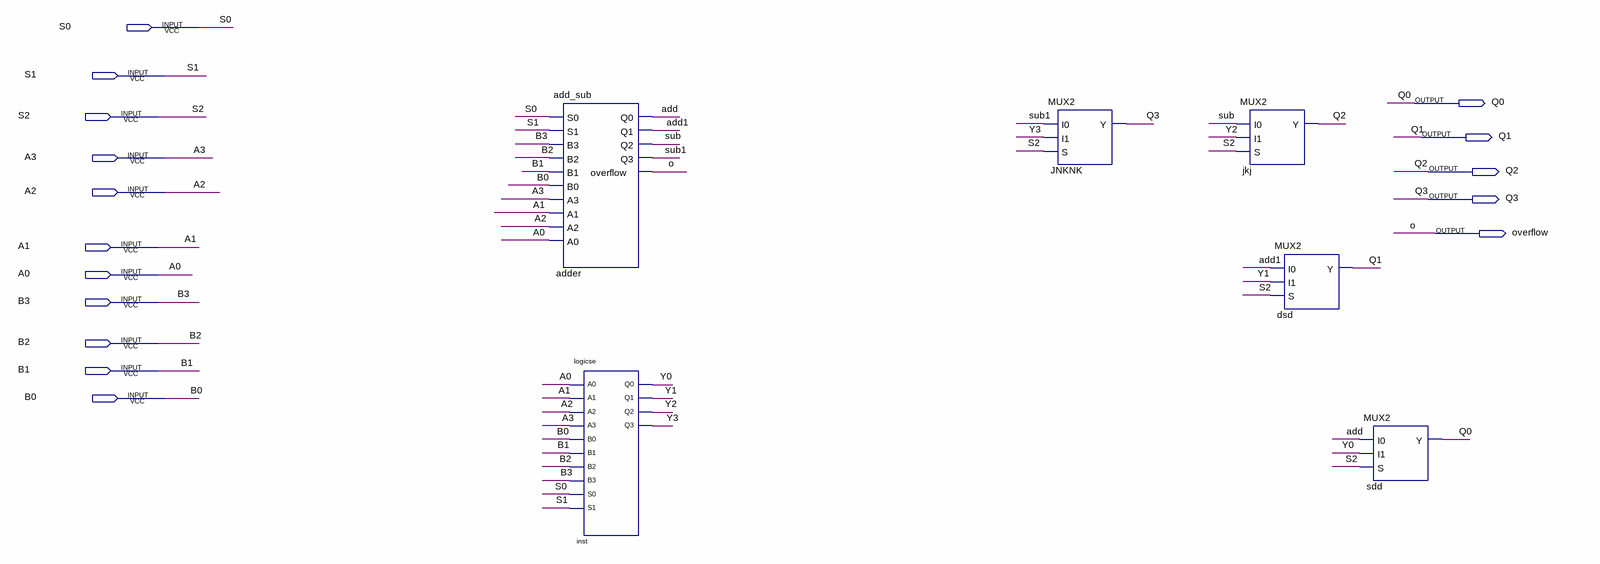
[diagram p0: schematic sheet]
// Quartus schematic ALU.bdf as structural Verilog: 6 symbols, 16 pins
module ALU (
  input  S0,
  input  S1,
  input  S2,
  input  A3,
  input  A2,
  input  A1,
  input  A0,
  input  B3,
  input  B2,
  input  B1,
  input  B0,
  output Q0,
  output Q1,
  output Q2,
  output Q3,
  output overflow
);

  wire add, add1, sub, sub1, Y0, Y1, Y2, Y3;

  add_sub adder (
    .S0(S0), .S1(S1), .B3(B3), .B2(B2), .B1(B1), .B0(B0), .A3(A3), .A1(A1), .A2(A2), .A0(A0), .Q0(add),
    .Q1(add1), .Q2(sub), .Q3(sub1), .overflow(overflow));
  logicse inst (
    .A0(A0), .A1(A1), .A2(A2), .A3(A3), .B0(B0), .B1(B1), .B2(B2), .B3(B3), .S0(S0), .S1(S1), .Q0(Y0),
    .Q1(Y1), .Q2(Y2), .Q3(Y3));
  MUX2 JNKNK (.I0(sub1), .I1(Y3), .S(S2), .Y(Q3));
  MUX2 jkj (.I0(sub), .I1(Y2), .S(S2), .Y(Q2));
  MUX2 dsd (.I0(add1), .I1(Y1), .S(S2), .Y(Q1));
  MUX2 sdd (.I0(add), .I1(Y0), .S(S2), .Y(Q0));

  // Other names for the same wires on the sheet: o = overflow
endmodule
